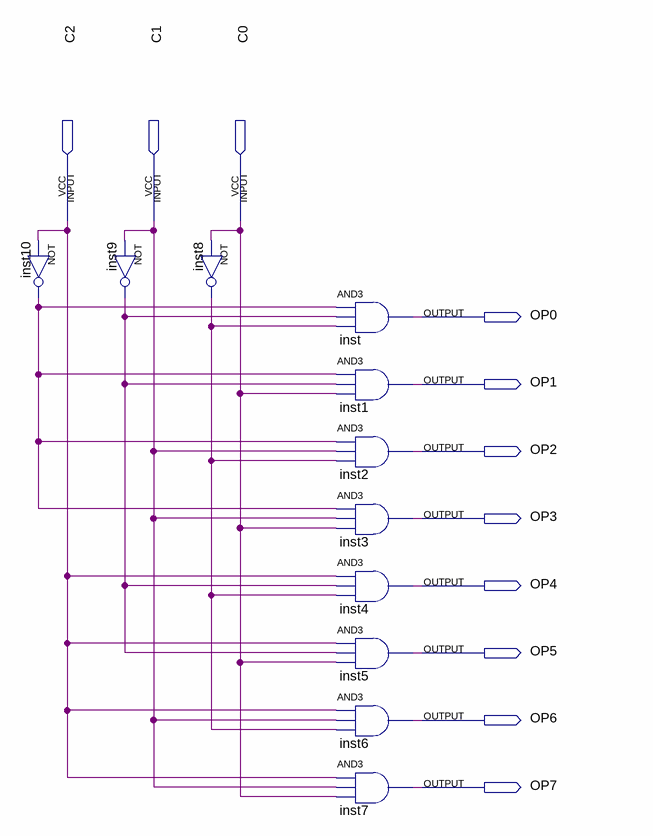
[diagram p0: schematic sheet]
// Quartus schematic decoder3to8.bdf as structural Verilog: 11 symbols, 11 pins
module decoder3to8 (
  input  C2,
  input  C1,
  input  C0,
  output OP0,
  output OP1,
  output OP2,
  output OP3,
  output OP4,
  output OP5,
  output OP6,
  output OP7
);

  wire inst8_out, inst9_out, inst10_out;

  not inst10 (inst10_out, C2);
  not inst9 (inst9_out, C1);
  not inst8 (inst8_out, C0);
  and inst (OP0, inst10_out, inst9_out, inst8_out);
  and inst1 (OP1, inst10_out, inst9_out, C0);
  and inst2 (OP2, inst10_out, C1, inst8_out);
  and inst3 (OP3, inst10_out, C1, C0);
  and inst4 (OP4, C2, inst9_out, inst8_out);
  and inst5 (OP5, C2, inst9_out, C0);
  and inst6 (OP6, C2, C1, inst8_out);
  and inst7 (OP7, C2, C1, C0);
endmodule
